# EAGLE board ce_hdd_v40 (EAGLE 6.2)
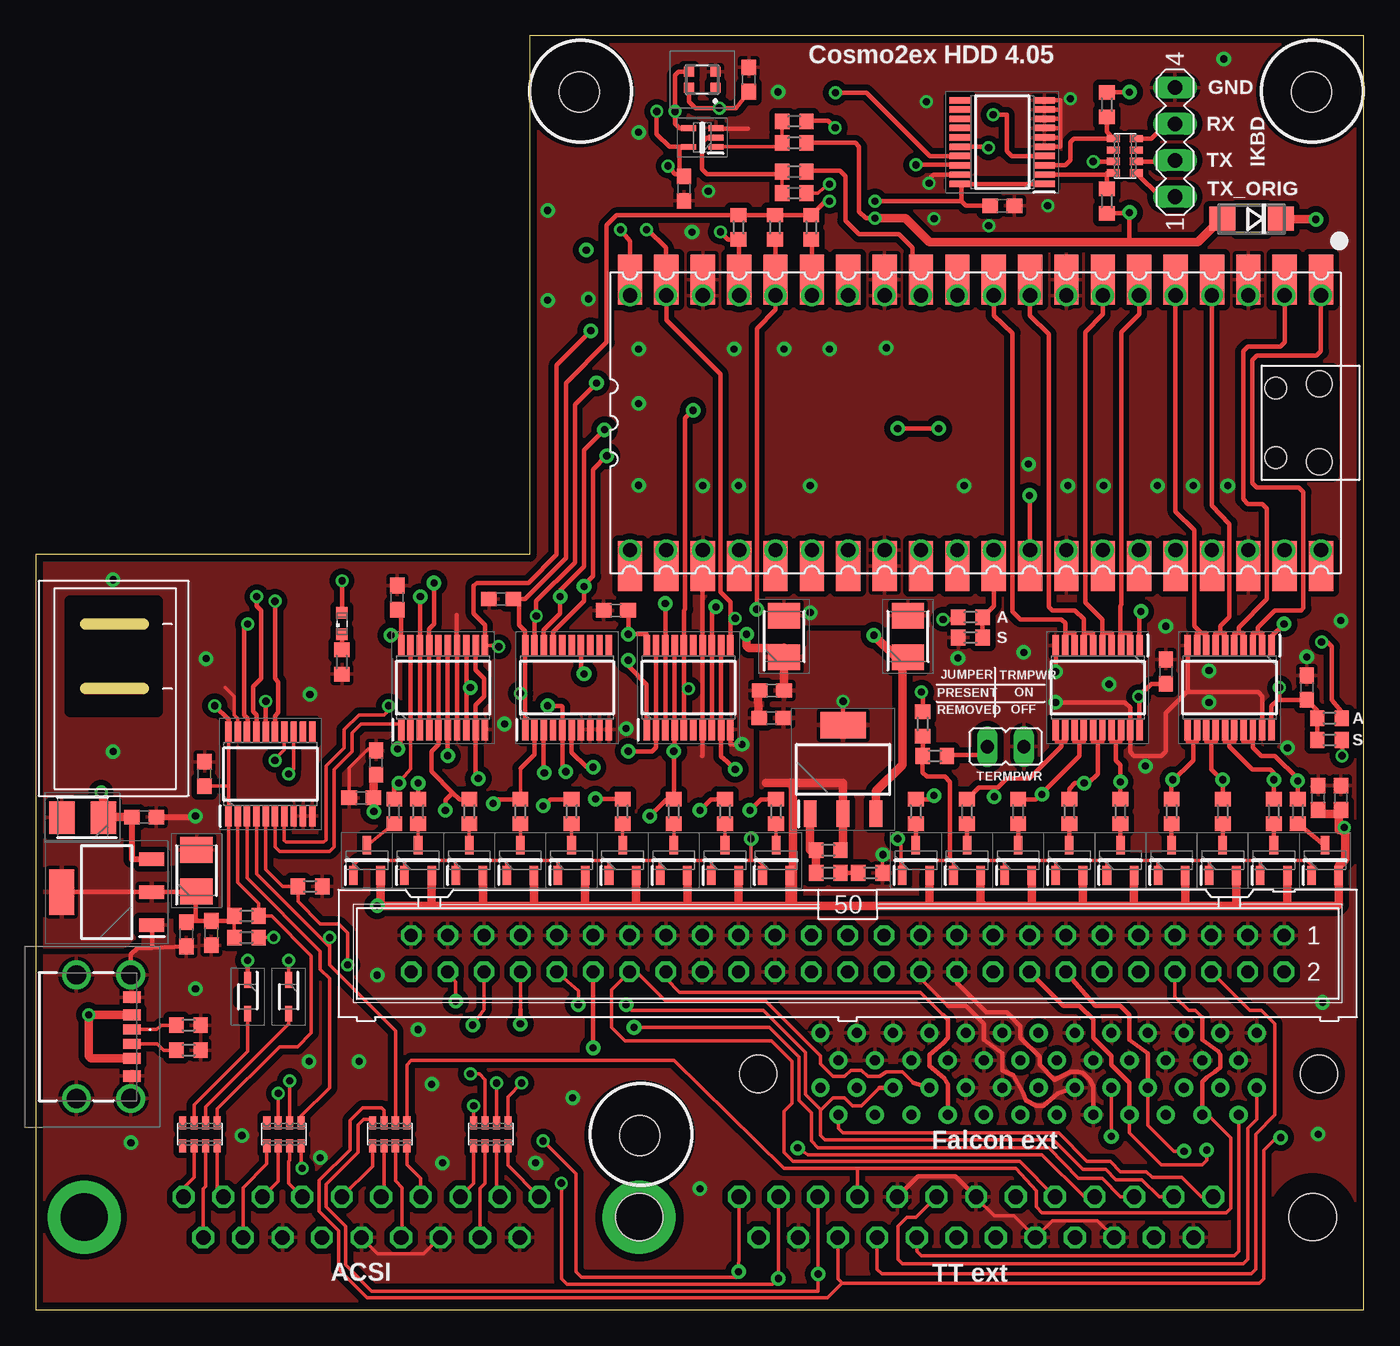
[diagram p5: board, top side]
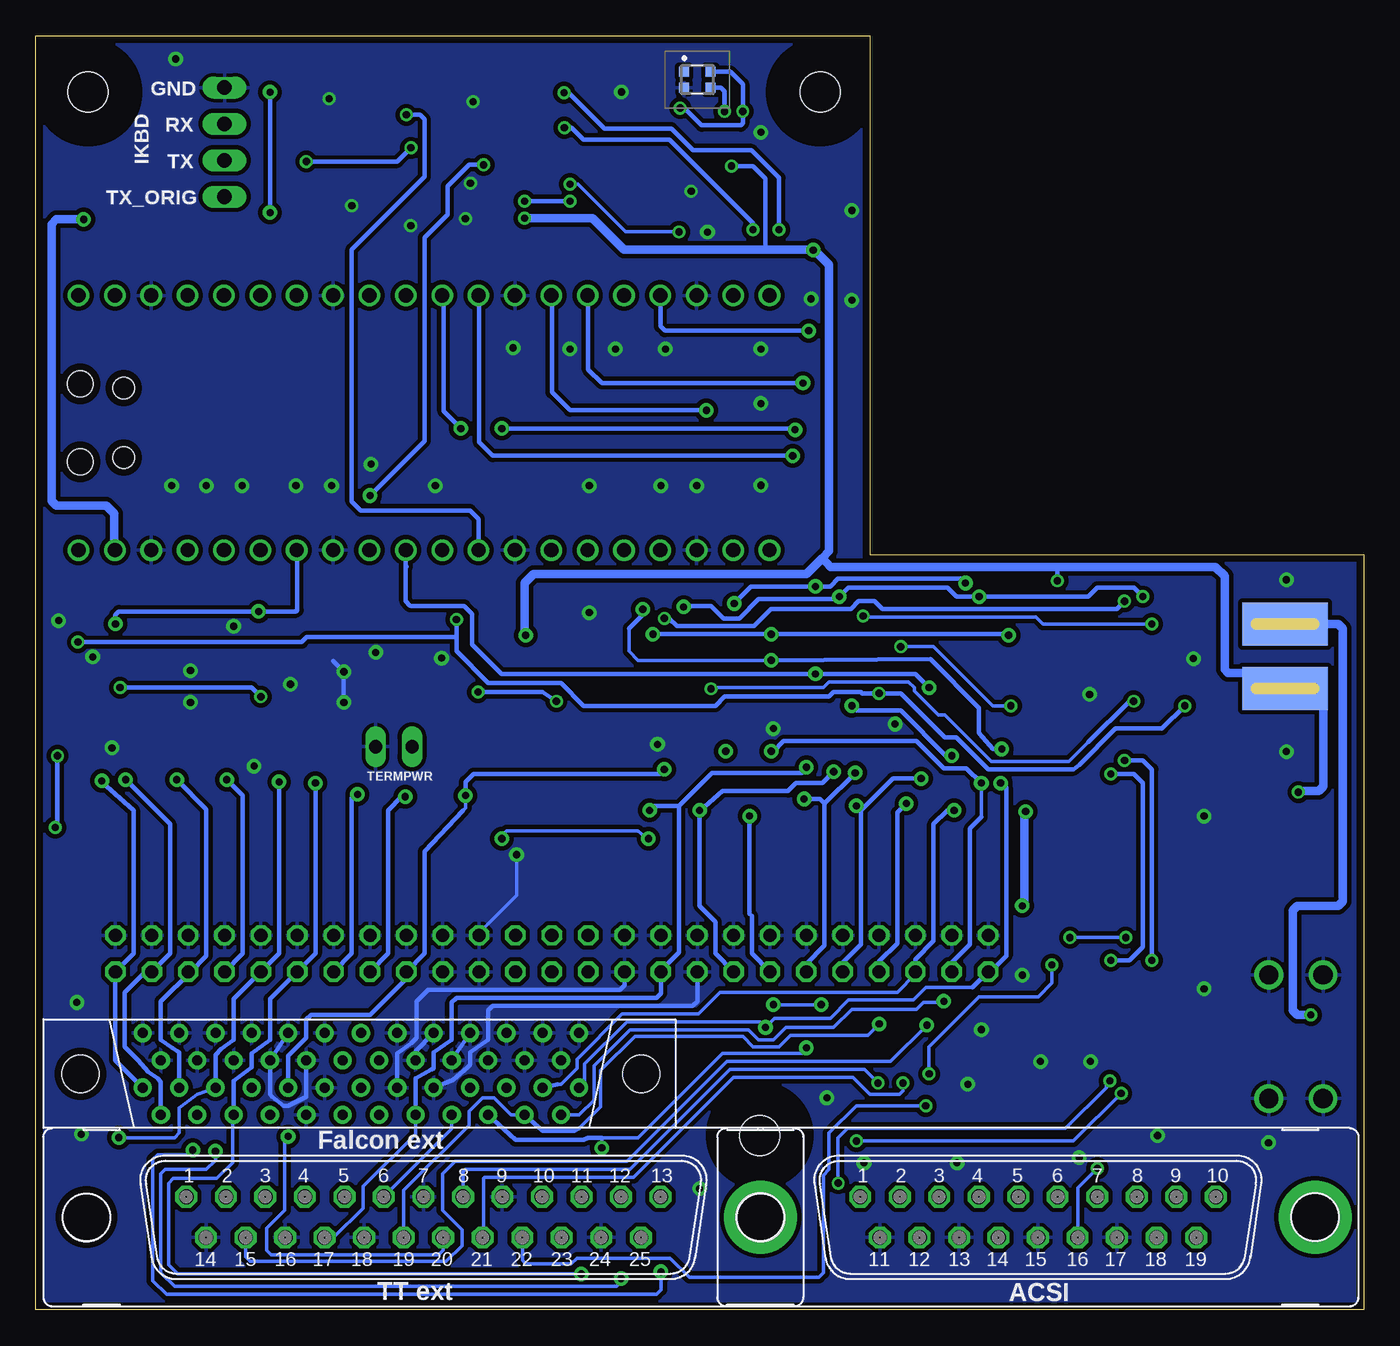
[diagram p6: board, bottom side, seen from below]

Size 92.75 x 89 mm. Coordinates in mm from the lower left corner, seen from the top.
Outline: 0,0 92.75,0 92.75,89 34.5,89 34.5,52.75 0,52.75 0,0
Copper layers (1*16): Top 0.035mm / dielectric 1.5mm / Bottom 0.035mm
Design rules: minimum track width 0.2mm, minimum drill 0.4mm, track to track 0.2mm, track to pad 0.2mm, pad to pad 0.2mm, via to via 0.2mm, smd to smd 0mil, copper to edge 0.5mm, drill to drill 0.5mm, minimum pad ring 10mil, minimum via ring 8mil, stop-mask expansion 4mil, vias tented up to drill 0mil, thermal gap 10mil
Holes 2.8 mm at 89.09,85.06 42.18,12.2 37.98,85.06
tKeepout: area 85.7,81.6 to 92.5,88.5; area 38.7,8.8 to 45.6,15.6; area 34.5,81.6 to 41.4,88.5
bKeepout: area 85.6,81.6 to 92.6,88.5; area 38.7,8.7 to 45.6,15.7; area 34.5,81.6 to 41.4,88.5
tRestrict: area 85.6,81.6 to 92.5,88.5; area 38.7,8.7 to 45.6,15.6; area 34.5,81.6 to 41.4,88.5; area 83.9,75.2 to 86,77.1; area 10.1,30.2 to 12.3,31.1; area 14.2,21.5 to 15.4,22.3; area 17.1,21.4 to 18.2,22.3; area 2.8,33.2 to 3.7,35.6; area 59.8,46.6 to 62,47.5; area 51,46.6 to 53.5,47.5
bRestrict: area 85.6,81.6 to 92.6,88.5; area 38.7,8.7 to 45.6,15.7; area 34.5,81.6 to 41.4,88.5

## Footprints (pad centres in the part's own frame; a part is rotated, then mirrored left to right if it is on the bottom)
C0603 = smd 1.1 x 1: 1 -0.85,0; 2 0.85,0
CAPPM3528X210N = smd 1.8 x 2.25: 1 -1.45,0; 2 1.45,0
DO214AC = smd 1.8 x 1.7: A 2.05,0; C -2.05,0
SOD2613X100N = smd 1.1 x 0.5: 1 -1.175,0; 2 1.175,0
PICO-PKG = drill 1: 1 -8.89,24.13; 2 -8.89,21.59; 3 -8.89,19.05; 4 -8.89,16.51; 5 -8.89,13.97; 6 -8.89,11.43; 7 -8.89,8.89; 8 -8.89,6.35; 9 -8.89,3.81; 10 -8.89,1.27; 11 -8.89,-1.27; 12 -8.89,-3.81; 13 -8.89,-6.35; 14 -8.89,-8.89; 15 -8.89,-11.43; 16 -8.89,-13.97; 17 -8.89,-16.51; 18 -8.89,-19.05; 19 -8.89,-21.59; 20 -8.89,-24.13; 21 8.89,-24.13; 22 8.89,-21.59; 23 8.89,-19.05; 24 8.89,-16.51; 25 8.89,-13.97; 26 8.89,-11.43; 27 8.89,-8.89; 28 8.89,-6.35; 29 8.89,-3.81; 30 8.89,-1.27; 31 8.89,1.27; 32 8.89,3.81; 33 8.89,6.35; 34 8.89,8.89; 35 8.89,11.43; 36 8.89,13.97; 37 8.89,16.51; 38 8.89,19.05; 39 8.89,21.59; 40 8.89,24.13 | smd 3.5 x 1.7: P$1 -10,24.13; P$2 -10,21.59; P$3 -10,19.05; P$4 -10,16.51; P$5 -10,13.97; P$6 -10,11.43; P$7 -10,8.89; P$8 -10,6.35; P$9 -10,3.81; P$10 -10,1.27; P$11 -10,-1.27; P$12 -10,-3.81; P$13 -10,-6.35; P$14 -10,-8.89; P$15 -10,-11.43; P$16 -10,-13.97; P$17 -10,-16.51; P$18 -10,-19.05; P$19 -10,-21.59; P$20 -10,-24.13; P$21 10,-24.13; P$22 10,-21.59; P$23 10,-19.05; P$24 10,-16.51; P$25 10,-13.97; P$26 10,-11.43; P$27 10,-8.89; P$28 10,-6.35; P$29 10,-3.81; P$30 10,-1.27; P$31 10,1.27; P$32 10,3.81; P$33 10,6.35; P$34 10,8.89; P$35 10,11.43; P$36 10,13.97; P$37 10,16.51; P$38 10,19.05; P$39 10,21.59; P$40 10,24.13 | hole 1.8: -2.725,24; 2.725,24 | hole 1.5: -2.425,20.97; 2.425,20.97
SOP65P640X120-20N = smd 1.475 x 0.45: 1 -2.938,2.925; 2 -2.938,2.275; 3 -2.938,1.625; 4 -2.938,0.975; 5 -2.938,0.325; 6 -2.938,-0.325; 7 -2.938,-0.975; 8 -2.938,-1.625; 9 -2.938,-2.275; 10 -2.938,-2.925; 11 2.938,-2.925; 12 2.938,-2.275; 13 2.938,-1.625; 14 2.938,-0.975; 15 2.938,-0.325; 16 2.938,0.325; 17 2.938,0.975; 18 2.938,1.625; 19 2.938,2.275; 20 2.938,2.925
SOT230P700X180-4N = smd 1.75 x 0.95: 1 -3.15,2.3; 2 -3.15,0; 3 -3.15,-2.3 | smd 1.75 x 3.2: 4 3.15,0
SOT65P212X110-5N = smd 1.05 x 0.4: 1 -0.95,0.65; 2 -0.95,0; 3 -0.95,-0.65; 4 0.95,-0.65; 5 0.95,0.65
SOP65P640X110-20N = smd 1.475 x 0.45: 1 -2.938,2.925; 2 -2.938,2.275; 3 -2.938,1.625; 4 -2.938,0.975; 5 -2.938,0.325; 6 -2.938,-0.325; 7 -2.938,-0.975; 8 -2.938,-1.625; 9 -2.938,-2.275; 10 -2.938,-2.925; 11 2.938,-2.925; 12 2.938,-2.275; 13 2.938,-1.625; 14 2.938,-0.975; 15 2.938,-0.325; 16 2.938,0.325; 17 2.938,0.975; 18 2.938,1.625; 19 2.938,2.275; 20 2.938,2.925
SOT230P700X185-4N = smd 1.85 x 0.9: 1 -3.1,2.3; 2 -3.1,0; 3 -3.1,-2.3 | smd 1.85 x 3.2: 4 3.1,0
MA04-1 = drill 1.016 long: 1 -3.81,0; 2 -1.27,0; 3 1.27,0; 4 3.81,0
USB4125GFA = smd 0.7 x 1.2: A5 -0.5,2.778; B5 0.5,2.778 | smd 0.76 x 1.2: A9 1.52,2.778; B9 -1.52,2.778 | smd 0.8 x 1.2: A12 2.75,2.778; B12 -2.75,2.778 | drill 1.34 pad 2.01: MH1 4.32,2.698; MH2 4.32,-1.102; MH3 -4.32,-1.102; MH4 -4.32,2.698
M19 = drill 1.016 octagon: 1 -12.751,1.422; 2 -9.982,1.422; 3 -7.239,1.422; 4 -4.47,1.422; 5 -1.702,1.422; 6 1.041,1.422; 7 3.81,1.422; 8 6.579,1.422; 9 9.322,1.422; 10 12.09,1.422; 11 -11.379,-1.422; 12 -8.611,-1.422; 13 -5.842,-1.422; 14 -3.099,-1.422; 15 -0.33,-1.422; 16 2.438,-1.422; 17 5.182,-1.422; 18 7.95,-1.422; 19 10.719,-1.422 | drill 3.302 pad 5.08: G1 -19.71,0; G2 19.03,0
HD50_MALE = drill 0.7 pad 1.27: P1 0,1.27; P2 1.27,-0.63; P3 2.54,1.27; P4 3.81,-0.63; P5 5.08,1.27; P6 6.35,-0.63; P7 7.62,1.27; P8 8.89,-0.63; P9 10.16,1.27; P10 11.43,-0.63; P11 12.7,1.27; P12 13.97,-0.63; P13 15.24,1.27; P14 16.51,-0.63; P15 17.78,1.27; P16 19.05,-0.63; P17 20.32,1.27; P18 21.59,-0.63; P19 22.86,1.27; P20 24.13,-0.63; P21 25.4,1.27; P22 26.67,-0.63; P23 27.94,1.27; P24 29.21,-0.63; P25 30.48,1.27; P26 0,-2.54; P27 1.27,-4.44; P28 2.54,-2.54; P29 3.81,-4.44; P30 5.08,-2.54; P31 6.35,-4.44; P32 7.62,-2.54; P33 8.89,-4.44; P34 10.16,-2.54; P35 11.43,-4.44; P36 12.7,-2.54; P37 13.97,-4.44; P38 15.24,-2.54; P39 16.51,-4.44; P40 17.78,-2.54; P41 19.05,-4.44; P42 20.32,-2.54; P43 21.59,-4.44; P44 22.86,-2.54; P45 24.13,-4.44; P46 25.4,-2.54; P47 26.67,-4.44; P48 27.94,-2.54; P49 29.21,-4.44; P50 30.48,-2.54 | hole 2.6: -4.35,-1.58; 34.83,-1.58
M25V = drill 1.016 octagon: 1 -16.561,1.422; 2 -13.792,1.422; 3 -11.049,1.422; 4 -8.28,1.422; 5 -5.512,1.422; 6 -2.769,1.422; 7 0,1.422; 8 2.769,1.422; 9 5.512,1.422; 10 8.28,1.422; 11 11.049,1.422; 12 13.792,1.422; 13 16.561,1.422; 14 -15.189,-1.422; 15 -12.421,-1.422; 16 -9.652,-1.422; 17 -6.909,-1.422; 18 -4.14,-1.422; 19 -1.372,-1.422; 20 1.372,-1.422; 21 4.14,-1.422; 22 6.909,-1.422; 23 9.652,-1.422; 24 12.421,-1.422; 25 15.189,-1.422 | hole 3.302: 23.52,0; -23.52,0
ML50 = drill 0.914 octagon: 1 -30.48,-1.27; 2 -30.48,1.27; 3 -27.94,-1.27; 4 -27.94,1.27; 5 -25.4,-1.27; 6 -25.4,1.27; 7 -22.86,-1.27; 8 -22.86,1.27; 9 -20.32,-1.27; 10 -20.32,1.27; 11 -17.78,-1.27; 12 -17.78,1.27; 13 -15.24,-1.27; 14 -15.24,1.27; 15 -12.7,-1.27; 16 -12.7,1.27; 17 -10.16,-1.27; 18 -10.16,1.27; 19 -7.62,-1.27; 20 -7.62,1.27; 21 -5.08,-1.27; 22 -5.08,1.27; 23 -2.54,-1.27; 24 -2.54,1.27; 25 0,-1.27; 26 0,1.27; 27 2.54,-1.27; 28 2.54,1.27; 29 5.08,-1.27; 30 5.08,1.27; 31 7.62,-1.27; 32 7.62,1.27; 33 10.16,-1.27; 34 10.16,1.27; 35 12.7,-1.27; 36 12.7,1.27; 37 15.24,-1.27; 38 15.24,1.27; 39 17.78,-1.27; 40 17.78,1.27; 41 20.32,-1.27; 42 20.32,1.27; 43 22.86,-1.27; 44 22.86,1.27; 45 25.4,-1.27; 46 25.4,1.27; 47 27.94,-1.27; 48 27.94,1.27; 49 30.48,-1.27; 50 30.48,1.27
JP1 = drill 0.914 long: 1 0,-1.27; 2 0,1.27
SML0603 = smd 0.8 x 0.8: A 0.75,0; C -0.75,0
WS2812C2020 = smd 0.7 x 0.7: 1 0.915,-0.55; 2 0.915,0.55; 3 -0.915,0.55; 4 -0.915,-0.55
SOT95P237X112-3N = smd 1.3 x 0.6: 1 -1.05,0.95; 2 -1.05,-0.95; 3 1.05,0
R0603 = smd 1 x 1.1: 1 -0.85,0; 2 0.85,0
CTS742C083 = smd 0.5 x 0.9: 1 -1.2,-0.8; 2 -0.4,-0.8; 3 0.4,-0.8; 4 1.2,-0.8; 5 1.2,0.8; 6 0.4,0.8; 7 -0.4,0.8; 8 -1.2,0.8
SMRS-1 = smd 3 x 6 bottom: P$1 11.5,4.7; P$2 7,4.7

## Placement (x,y rotation side)
C1  100 nF  [C0603]  67.5,77.13 180 top
C2  100 nF  [C0603]  88.78,43.47 90 top
C3  100 nF  [C0603]  78.93,44.58 90 top
C4  10 uF  [CAPPM3528X210N]  11.23,30.69 90 top
C5  100 nF  [C0603]  12.26,26.33 270 top
C6  1 uF  [C0603]  10.51,26.25 270 top
C7  10 uF  [CAPPM3528X210N]  3.27,34.39 180 top
C8  1 uF  [C0603]  7.57,34.42 0 top
C9  100 nF  [C0603]  45.28,78.32 270 top
C10  100 nF  [C0603]  49.8,85.94 90 top
C101  1 uF  [C0603]  11.78,37.44 90 top
C201  100 nF  [C0603]  32.5,49.66 180 top
C202  100 nF  [C0603]  51.41,43.27 180 top
C203  1 uF  [C0603]  51.37,41.35 180 top
C204  100 nF  [C0603]  40.52,48.87 180 top
C205  100 nF  [C0603]  25.25,49.76 90 top
C206  10 uF  [CAPPM3528X210N]  60.91,47.04 90 top
C207  10 uF  [CAPPM3528X210N]  52.26,47.04 90 top
C208  100 nF  [C0603]  22.73,35.77 180 top
C209  100 nF  [C0603]  89.57,35.77 90 top
C210  1 uF  [C0603]  23.77,38.23 90 top
C211  1 uF  [C0603]  91.16,35.77 90 top
D1  SK110-DIO  [DO214AC]  84.92,76.22 180 top
D101  BAT54WSTR  [SOD2613X100N]  14.8,21.88 270 top
D102  BAT54WSTR  [SOD2613X100N]  17.66,21.88 270 top
IC1  RASPBERRY_PICOSMD-TH  [PICO-PKG]  65.64,61.97 270 top
IC2  74LVC245AT20-13  [SOP65P640X120-20N]  83.38,43.47 270 top
IC3  74LVC245AT20-13  [SOP65P640X120-20N]  74.17,43.47 270 top
IC4  TLV1117LV33DCYR  [SOT230P700X180-4N]  4.95,29.18 180 top
IC5  74LVC245AT20-13  [SOP65P640X120-20N]  67.5,81.57 180 top
IC6  74AHCT1G08GW,125  [SOT65P212X110-5N]  46.55,81.89 180 top
IC101  74LVC245AT20-13  [SOP65P640X120-20N]  16.39,37.44 90 top
IC201  74LVC245AT20-13  [SOP65P640X120-20N]  37.1,43.47 90 top
IC202  74LVC373APW,118  [SOP65P640X110-20N]  28.45,43.47 90 top
IC203  74LVC373APW,118  [SOP65P640X110-20N]  45.59,43.47 90 top
IC204  AZ1117H-ADJTRE1  [SOT230P700X185-4N]  56.39,37.76 90 top
J1  [MA04-1]  79.57,81.57 90 top
J2  USB4125-GF-A  [USB4125GFA]  3.94,19.09 270 top
J101  M19  [M19]  22.42,6.48 0 bottom
J201  TE Connectivity - 5173280-3  [HD50_MALE]  85.28,18.07 0 bottom
J202  [M25V]  65.68,6.48 0 bottom
J203  ZL231-50PG  [ML50]  56.71,24.9 180 top
JP201  [JP1]  67.74,39.34 270 top
LED1  [SML0603]  21.39,47.94 90 top
LED2  WS2812C-2020  [WS2812C2020]  46.55,85.94 0 top
LED3  WS2812C-2020  [WS2812C2020]  46.55,85.94 180 bottom
Q201  FDV304P  [SOT95P237X112-3N]  90.05,31.41 90 top
Q202  FDV304P  [SOT95P237X112-3N]  86.47,31.41 90 top
Q203  FDV304P  [SOT95P237X112-3N]  82.9,31.41 90 top
Q204  FDV304P  [SOT95P237X112-3N]  79.33,31.41 90 top
Q205  FDV304P  [SOT95P237X112-3N]  75.76,31.41 90 top
Q206  FDV304P  [SOT95P237X112-3N]  72.19,31.41 90 top
Q207  FDV304P  [SOT95P237X112-3N]  68.61,31.41 90 top
Q208  FDV304P  [SOT95P237X112-3N]  65.04,31.41 90 top
Q209  FDV304P  [SOT95P237X112-3N]  61.47,31.41 90 top
Q210  FDV304P  [SOT95P237X112-3N]  51.71,31.41 90 top
Q211  FDV304P  [SOT95P237X112-3N]  48.13,31.41 90 top
Q212  FDV304P  [SOT95P237X112-3N]  44.56,31.41 90 top
Q213  FDV304P  [SOT95P237X112-3N]  40.99,31.41 90 top
Q214  FDV304P  [SOT95P237X112-3N]  37.42,31.41 90 top
Q215  FDV304P  [SOT95P237X112-3N]  33.85,31.41 90 top
Q216  FDV304P  [SOT95P237X112-3N]  30.28,31.41 90 top
Q217  FDV304P  [SOT95P237X112-3N]  26.7,31.41 90 top
Q218  FDV304P  [SOT95P237X112-3N]  23.13,31.41 90 top
R1  10k  [R0603]  74.81,77.44 270 top
R2  10k  [R0603]  74.81,84.19 90 top
R3  5k1 (1%)  [R0603]  10.67,19.9 0 top
R4  5k1 (1%)  [R0603]  10.67,18.15 0 top
R5  1k  [R0603]  21.38,45.26 270 top
R6  10k  [R0603]  54.17,75.62 270 top
R7  10k  [R0603]  51.63,75.62 270 top
R8  10k  [R0603]  49.09,75.62 270 top
R101  0R  [R0603]  90.36,41.33 0 top
R102  10k  [R0603]  14.72,27.52 0 top
R103  10k  [R0603]  14.72,26.01 0 top
R104  10k  [R0603]  19.16,29.58 180 top
R125  100k  [R0603]  65.28,48.39 0 top
R150  220R  [R0603]  52.98,79.51 0 top
R151  10k  [R0603]  52.98,81.52 0 top
R201  0R  [R0603]  90.36,39.82 0 top
R202  10k  [R0603]  61.95,40.93 270 top
R203  220R  [R0603]  62.79,38.7 0 top
R204  110 R  [R0603]  88.14,34.82 90 top
R205  110 R  [R0603]  86.47,34.82 90 top
R206  110 R  [R0603]  82.9,34.82 90 top
R207  110 R  [R0603]  79.33,34.82 90 top
R208  110 R  [R0603]  75.76,34.82 90 top
R209  110 R  [R0603]  72.19,34.82 90 top
R210  110 R  [R0603]  68.61,34.82 90 top
R211  110 R  [R0603]  65.04,34.82 90 top
R212  110 R  [R0603]  61.47,34.82 90 top
R213  110 R  [R0603]  51.71,34.82 90 top
R214  110 R  [R0603]  48.13,34.82 90 top
R215  110 R  [R0603]  44.56,34.82 90 top
R216  110 R  [R0603]  40.99,34.82 90 top
R217  110 R  [R0603]  37.42,34.82 90 top
R218  110 R  [R0603]  33.85,34.82 90 top
R219  110 R  [R0603]  30.28,34.82 90 top
R220  110 R  [R0603]  26.7,34.82 90 top
R221  110 R  [R0603]  25.04,34.82 90 top
R222  120 R - 1%  [R0603]  55.36,32.12 180 top
R223  150 R  [R0603]  55.36,30.53 0 top
R224  4.7 R  [R0603]  58.3,30.53 180 top
R225  100k  [R0603]  65.28,46.97 180 top
R250  220R  [R0603]  52.98,78 0 top
R251  220R  [R0603]  52.98,83.03 0 top
RN1  DR1206-47R-4/8  [CTS742C083]  76.08,80.62 270 top
RN101  DR1206-47R-4/8  [CTS742C083]  31.78,12.28 0 top
RN102  DR1206-47R-4/8  [CTS742C083]  24.72,12.28 0 top
RN103  DR1206-47R-4/8  [CTS742C083]  17.34,12.28 0 top
RN104  DR1206-47R-4/8  [CTS742C083]  11.46,12.28 0 top
SW1  SMSR-1  [SMRS-1]  10.19,36.41 90 top

## Tracks (layer width: path | path; a pad name or v marks a point on that pad's centre or on a via)
3V3(OUT)
  Top 0.305: IC1.P$36 IC1.36
5V  (via drill 0.5, 0.5 pad 1.02)
  Top 0.305: IC204.3 58.69,34.76 | R1.2 76.34,76.59 v76.39,76.65 76.39,74.59 | v76.39,85.06 74.83,85.06 R2.2 | 38.21,74.27 v38.45,74.03 | C9.1 45.1,79.35 | 45.1,79.35 44.64,79.35 v44.17,79.91 | 44.96,81.24 IC6.5 | 45.1,79.35 44.96,79.49 44.96,81.24 | LED1.A 21.39,51.09 v21.39,50.93 | 44.96,81.24 44.26,81.24 43.37,82.13 v43.37,83.72 | R151.2 57.23,81.52 57.5,81.25 57.5,76.73 57.98,76.25 v58.61,76.25 | C10.1 48.9,83.95 v47.74,83.95 46.07,83.95 45.63,84.39 LED2.4
  Top 0.406: IC4.3 6.72,31.48 C8.1
  Top 0.61: 60.52,45.38 60.52,38.08 58.69,36.25 58.69,34.76 | 60.52,45.38 60.52,45.54 | v58.53,47.12 60.06,45.59 C206.1 60.91,45.38 60.52,45.38 | C8.1 4.25,34.42 C7.1 4.72,36.01 v4.56,36.17 | D1.A 82.84,76.25 82.82,76.25 81.16,74.59 76.39,74.59 62.42,74.59 60.76,76.25 v58.61,76.25
  Bottom 0.305: v76.39,76.65 v76.39,85.06 | v38.45,74.03 38.41,74.07 | v44.17,79.91 42.66,79.91 41.78,79.03 41.78,74.07 | v21.39,50.93 21.39,51.89 | v47.74,83.95 47.45,83.95 46.25,82.75 43.5,82.75 43.37,82.88 v43.37,83.72 43.37,85.62 44.24,86.49 LED3.4
  Bottom 0.61: 58.53,47.36 v58.53,47.12 58.61,47.2 58.61,50.77 57.98,51.41 38.93,51.41 37.82,52.52 | 37.82,52.52 37.34,53 37.34,73 38.41,74.07 41.78,74.07 51.67,74.07 53.85,76.25 v58.61,76.25 | v4.56,36.17 4.24,36.25 3.13,36.25 2.81,36.57 2.81,43.41 SW1.P$2 7.19,43.41 8.29,44.5 9.48,44.5 9.72,44.74 9.72,51.25 10.35,51.89 21.39,51.89 37.26,51.89 37.82,52.52
5V_IN  (via drill 0.5)
  Top 0.61: J2.B9 v3.69,20.61 3.69,17.76 3.87,17.57 J2.A9
  Bottom 0.61: SW1.P$1 1.78,47.91 1.46,47.59 1.46,28.55 1.78,28.23 4.64,28.23 4.95,27.91 4.95,20.93 4.64,20.61 v3.69,20.61
AA1  (via drill 0.5)
  Top 0.254: v18.61,9.9 18.54,9.97 RN103.4
  Bottom 0.254: 18.53,9.82 v18.61,9.9 19.98,8.53 J101.16
AAAA
  Top 0.305: Q201.3 R204.1
AACK
  Top 0.254: J101.14 25.59,5.14 25.59,8.55 25.12,9.02 RN102.3
ACK  (via drill 0.5 pad 1.02)
  Top 0.254: J202.5 68.73,10.37 52.9,10.37 52.26,11.01 52.26,13.87 52.82,14.42 52.82,17.36 51.39,18.79 41.15,18.79 40.2,19.74 40.2,22.36 J203.38 | 61.31,15.85 60.52,16.64 59.41,16.64 58.93,16.33 58.14,16.33 57.66,16.72 56.95,16.72 56.47,16.33 55.68,16.33 54.8,17.2 54.8,17.76 50.99,21.56 44.01,21.56 41.94,23.63 J203.38 | 41.47,23.55 J203.38
  Top 0.305: IC203.17 IC203.4 44.62,39.08 v44.56,39.03 R215.2 44.06,35.67 v42.9,34.5 | 61.31,15.85 J201.P44
  Bottom 0.305: v44.56,39.03 44.33,39.03 | J203.38 42.74,24.9 42.74,27.52 42.9,27.68 v42.9,34.5
ACS
  Top 0.254: J101.9 12.66,8.34 RN104.4
AD0
  Top 0.254: J101.1 32.98,10.09 RN101.4
AD1
  Top 0.254: J101.2 32.18,8.12 RN101.3
AD2
  Top 0.254: J101.3 30.58,8.83 RN101.1
AD3
  Top 0.254: J101.4 26.86,7.93 26.86,9.18 25.92,10.13 RN102.4
AD4
  Top 0.254: J101.5 24.32,8.11 RN102.2
AD5
  Top 0.254: J101.6 23.52,10.05 RN102.1
AD6
  Top 0.254: J101.7 17.66,8.86 17.66,10.37 17.74,10.46 RN103.3
AD7
  Top 0.254: J101.8 16.94,9.01 RN103.2
ADRQ
  Top 0.254: J101.19 11.7,8.47 11.86,8.63 RN104.3
AINT
  Top 0.254: J101.10 10.33,8.52 11.06,9.26 RN104.2
ARESET
  Top 0.254: J101.12 31.03,8.51 31.38,8.86 RN101.2
ARNW
  Top 0.254: J101.18 14.47,8.54 16.14,10.21 RN103.1
ATN  (via drill 0.5 pad 1.02)
  Top 0.305: IC201.6 37.43,38.94 38.45,37.92 v38.93,37.92 | v49.88,34.9 50.65,35.67 R213.2
  Bottom 0.254: J202.17 71.94,5.06 69.88,7.12 69.88,8.63 66.23,12.28 J201.P41
  Bottom 0.305: J201.P41 66.23,16.17 65.12,16.8 64.96,16.88 64.96,17.99 63.69,18.87 63.69,21.49 63.38,21.8 49.41,21.8 49.09,22.12 J203.32 | J203.32 49.09,23.79 | v49.88,34.9 49.56,35.22 47.82,35.22 | v38.93,37.92 39.24,37.52 45.52,37.52 47.82,35.22 | J203.32 49.09,23.71 47.82,24.98 47.82,35.22
ATN_MSG  (via drill 0.5 pad 1.02)
  Top 0.305: IC202.13 30.07,43.47 | 30.07,43.47 IC202.8 | IC1.P$31 IC1.31 66.91,49.17 R125.2 R225.1 | IC201.14 38.08,44.64 v38.29,44.42 | 30.07,43.47 v30.36,43.47
  Bottom 0.305: 66.87,51.93 IC1.P$31 | IC1.P$31 IC1.31 | v30.36,43.47 31.31,44.42 v38.29,44.42 60.2,44.42 62.27,46.49 62.27,48.62 62.84,49.19 66.55,49.19 66.62,49.2 66.91,49.51 IC1.P$31
BA1
  Top 0.254: RN103.5 18.54,13.56 20.51,15.53 20.51,23.15 19.88,23.79 19.88,25.06 14.76,30.18 IC101.3
BACK  (via drill 0.5)
  Top 0.254: RN102.6 25.12,19.5 20.51,24.11 20.51,25.38 | 20.51,25.38 15.43,30.45 15.43,34.48 IC101.4 | R103.2 v16.62,26.01 | v20.51,26.01 20.51,25.38
  Bottom 0.254: v16.62,26.01 v20.51,26.01
BCS
  Top 0.254: IC101.2 14.11,29.87 15.57,28.41 R102.2 16.46,27.52 19.24,24.74 19.24,19.34 18.29,18.39 17.02,18.39 12.66,14.03 RN104.5
BRESET  (via drill 0.5)
  Top 0.254: RN101.7 31.38,16.09 30.99,16.48 v30.36,16.48 | IC101.5 16.06,31.41 16.07,31.25 16.07,30.77 17.26,29.58 R104.2 18.31,28.53 19.88,26.96 21.15,26.96 21.78,26.33 v21.78,24.11
  Bottom 0.254: v30.36,16.48 30.36,18.39 26.86,21.88 22.73,21.88 21.78,22.84 v21.78,24.11
BSY  (via drill 0.5 pad 1.02)
  Top 0.254: 63.38,20.61 61.79,22.2 44.96,22.2 44.01,23.15 J203.36
  Top 0.305: IC202.15 IC202.6 v28.77,38.71 | 63.38,20.61 63.69,20.3 63.69,19.02 63.38,18.63 62.42,17.83 62.42,17.04 63.45,16.17 63.61,15.93 63.69,15.77 J201.P43 | v35.75,42.2 36.7,42.2 36.78,42.13 IC201.5 36.78,37.84 v37.02,37.6 | v46.39,34.9 47.16,35.67 R214.2
  Bottom 0.254: J202.6 63.69,12.66 J201.P43
  Bottom 0.305: J203.36 45.28,24.9 45.28,27.12 46.39,28.23 v46.39,34.9 46.31,34.9 44.8,36.25 40.2,36.25 39.64,36.8 37.82,36.8 v37.02,37.6 | v35.75,42.2 35.44,41.88 32.34,41.88 29.16,38.71 v28.77,38.71
C0
  Top 0.254: IC1.1 IC1.P$1
  Top 0.305: IC2.2 85.65,47.28 85.36,47.28 | 85.36,47.28 85,47.28 IC2.3 | 85.36,47.28 85.36,47.68 86.55,48.87 88.38,48.87 88.54,49.03 88.54,57.12 88.22,57.44 85.28,57.44 84.97,57.76 84.97,66.33 85.28,66.65 89.45,66.65 89.77,66.97 IC1.1
C1
  Top 0.254: IC1.2 IC1.P$2
  Top 0.305: IC2.4 84.33,46.41 84.33,47.28 84.01,47.28 | 84.01,47.28 83.7,47.28 IC2.5 | 84.01,47.28 84.01,47.68 86,49.66 86,55.99 85.68,56.31 84.65,56.31 84.33,56.62 84.33,66.97 84.65,67.28 86.91,67.28 87.23,67.6 IC1.2
C2
  Top 0.254: IC1.4 IC1.P$4
  Top 0.305: IC2.7 82.4,47.28 82.74,47.28 | 82.74,47.28 83.05,47.28 IC2.6 | 82.74,47.28 82.74,47.76 83.38,48.39 83.38,54.9 82.15,56.17 IC1.4
C3
  Top 0.254: IC1.5 IC1.P$5
  Top 0.305: IC2.9 81.1,47.28 81.39,47.28 | 81.39,47.28 81.75,47.28 IC2.8 | 81.39,47.28 80.92,47.76 80.92,54.48 79.61,55.78 IC1.5
C4
  Top 0.254: IC1.6 IC1.P$6
  Top 0.305: IC3.3 75.76,46.41 75.76,47.28 | 75.76,47.28 76.44,47.28 IC3.2 | 75.76,47.28 75.76,49.19 75.84,49.27 75.84,68.32 77.07,69.55 IC1.6
C5
  Top 0.254: IC1.7 IC1.P$7
  Top 0.305: IC3.5 74.49,46.41 74.49,47.28 | 74.49,47.28 75.14,47.28 IC3.4 | 74.49,47.28 74.49,48.23 73.3,49.43 73.3,68.32 74.53,69.55 IC1.7
C6
  Top 0.254: IC1.9 IC1.P$9
  Top 0.305: IC3.7 73.19,47.28 | 73.19,47.28 73.84,47.28 IC3.6 | 73.19,47.28 73.19,48.26 72.58,48.87 71,48.87 70.76,49.11 70.76,68.16 69.45,69.47 IC1.9
C7
  Top 0.254: IC1.10 IC1.P$10
  Top 0.305: IC3.9 71.89,47.28 | 71.89,47.28 72.55,47.28 IC3.8 | 71.89,47.28 71.89,47.97 71.63,48.23 68.77,48.23 68.22,48.79 68.22,68.24 66.91,69.47 IC1.10
C/D  (via drill 0.5 pad 1.02)
  Top 0.254: J203.46 31.31,21.01 v30.51,19.9
  Top 0.305: IC202.16 IC202.5 28.12,39.5 27.66,39.03 27.66,37.6 29.12,36.13 | R219.2 29.58,35.67 29.12,36.13 | v28.61,34.9 28.61,35.61 29.12,36.13
  Bottom 0.254: J202.15 78.1,3.71 77.78,3.39 64.09,3.39 62.98,4.5 62.98,5.61 64.33,6.96 64.33,9.5 63.45,10.37 51.47,10.37 44.48,17.36 33.05,17.36 v30.51,19.9 30.59,19.66 | 30.04,25.85 30.04,25.77 | J203.46 31.31,23.47 32.58,22.2 44.96,22.2 46.47,20.69 51.79,20.69 54.96,17.52 54.96,16.88 56.07,15.77 56.31,15.77
  Bottom 0.305: 30.04,25.85 30.04,33.95 29.09,34.9 v28.61,34.9 | 56.31,15.77 J201.P48 | 30.04,25.77 31.31,24.5 J203.46
CACK  (via drill 0.5, 0.5 pad 1.02)
  Top 0.254: IC1.14 IC1.P$14
  Top 0.305: 45.27,43.42 IC203.16 45.28,48.87 45.36,48.95 45.36,62.28 v45.91,62.84 | 45.27,43.42 IC203.5 | 45.27,43.42 45.32,43.39 v45.59,43.39 | v16.07,42.52 IC101.16
  Bottom 0.254: v45.59,43.39 45.28,43.47 37.74,43.47 37.34,43.87 31.78,43.87 31.39,43.47 31.39,43.23 29.72,41.57 29.24,41.57 25.99,38.31 20.59,38.31 19.24,39.66
  Bottom 0.305: v45.91,62.84 55.44,62.84 56.71,64.11 56.71,70.82 IC1.14 | 19.24,39.66 16.39,42.52 v16.07,42.52
CKEYB_RX
  Top 0.305: R2.1 74.81,82.29 RN1.1 72.51,81.82 72.27,81.57 72.27,80.3 71.91,79.95 IC5.3
CKEYB_TX  (via drill 0.5)
  Top 0.305: RN1.3 v73.86,80.22 v73.85,80.22 | v66.55,81.18 66.48,81.25 IC5.16
  Bottom 0.305: v73.85,80.22 67.5,80.22 v66.55,81.18
CKEYB_TX_ORIG
  Top 0.305: R1.1 74.81,79.35 | 74.81,79.35 74.81,79.42 RN1.4 75.2,79.35 74.81,79.35 | IC5.2 74.75,79.3 74.81,79.35
D0  (via drill 0.5, 0.5 pad 1.02)
  Top 0.254: J202.8 61.49,6.48 60.84,6.48 60.2,5.85 60.2,3.55 60.52,3.23 84.33,3.23 84.65,3.55 84.65,12.68 85.28,13.31 J201.P26 | v33.93,15.85 32.98,14.89 RN101.5
  Top 0.305: IC2.18 85,39.66 | 85,39.66 84.33,39.66 84.33,40.53 IC2.17 | 85,39.66 85,39.31 85.6,38.71 86.55,38.71 88.14,37.12 88.22,37.12 v88.14,36.96 R204.2
  Bottom 0.254: J202.8 62.91,9.65 62.74,9.82 51.23,9.82 44.25,16.8 34.88,16.8 v33.93,15.85
  Bottom 0.305: J201.P26 87.19,17.44 J203.2 85.92,24.9 85.92,34.9 88.14,36.88 v88.14,36.96
D1  (via drill 0.5, 0.5 pad 1.02)
  Top 0.254: J202.21 61.54,4.1 61.85,3.79 83.69,3.79 84.01,4.1 J201.P27 | v32.18,15.85 32.18,15.93 RN101.6
  Top 0.305: IC2.16 83.7,39.66 83.38,39.66 | 83.38,39.66 83.05,39.66 IC2.15 | 83.38,39.66 83.38,39.34 84.97,37.76 86.23,37.76 86.47,37.52 v86.47,37.04 R205.2
  Bottom 0.254: J202.21 61.47,5.13 61.47,9.18 61.39,9.26 50.99,9.26 44.01,16.25 35.67,16.25 34.48,15.06 32.42,15.06 32.18,15.29 v32.18,15.85
  Bottom 0.305: J201.P27 84.01,15.93 84.25,16.17 84.89,16.64 85.6,17.44 86.55,18.39 86.55,22.2 85.12,23.63 J203.4 83.38,24.9 83.38,33.95 v86.47,37.04
D2  (via drill 0.5, 0.5 pad 1.02)
  Top 0.254: J202.22 58.77,2.83 59.09,2.51 84.89,2.51 85.2,2.83 85.2,12.28 86.55,13.63 86.55,19.98 85.6,20.93 84.81,20.93 J203.6 | v30.59,14.26 30.58,14.19 RN101.8
  Top 0.305: IC2.14 82.42,40.53 82.42,39.66 82.11,39.66 | 82.11,39.66 81.75,39.66 IC2.13 | R206.2 82.9,36.96 82.82,37.04 | 82.82,37.04 82.11,37.76 82.11,39.66 | v82.9,37.04 82.82,37.04
  Bottom 0.254: 30.51,14.18 v30.59,14.26 35.44,14.26 37.34,12.36 37.34,9.82 37.74,9.42 37.74,2.59 38.05,2.28 47.1,2.28 48.45,3.63 54.96,3.63 55.36,3.23 58.53,3.23 58.77,3.46 J202.22
  Bottom 0.305: 81.95,23.63 80.84,24.74 80.84,34.98 v82.9,37.04 | 81.95,23.63 J203.6 | 81.95,23.63 84.01,21.56 84.01,18.87 83.22,18.31 82.82,18.07 82.74,17.99 J201.P28
D3  (via drill 0.5 pad 1.02)
  Top 0.254: J202.10 57.4,9.9 | 57.4,9.9 68.45,9.9 69.88,8.31 69.88,7.2 70.28,6.8 83.14,6.8 83.46,7.12 83.46,12.04 81.86,13.63 J201.P29 | 81.47,20.45 81,20.93 80.52,20.93 79.57,21.88 J203.8 | 57.4,9.9 52.26,9.9 44.56,17.44 26.23,17.44 25.92,17.13 RN102.5
  Top 0.305: IC2.11 80.45,39.66 80.84,39.66 | 80.84,39.66 81.1,39.66 IC2.12 | 81.47,20.45 81.47,18.87 82.58,18.07 82.74,17.83 82.74,16.96 82.35,16.64 81.79,16.25 81.47,15.93 J201.P29 | R207.2 79.33,36.88 | 79.33,36.88 80.84,38.39 80.84,39.66 | v79.41,37.04 79.33,36.88
  Bottom 0.305: J203.8 78.3,24.9 78.3,35.93 v79.41,37.04
D4  (via drill 0.5 pad 1.02)
  Top 0.254: J202.23 56.02,2.2 56.34,1.88 | 56.34,1.88 85.44,1.88 85.76,2.2 85.76,11.17 86.63,12.04 v86.95,12.04 | 56.34,1.88 56.31,1.88 55.28,0.85 23.13,0.85 21.15,2.83 21.15,5.53 19.8,6.88 19.8,9.05 21.94,11.19 21.94,13.23 22.81,14.1 24.15,14.1 24.32,13.93 RN102.7
  Top 0.305: IC3.17 75.14,39.66 | 75.14,39.66 75.12,39.66 | 75.14,39.66 75.44,39.66 | 75.44,39.66 75.76,39.66 75.76,40.53 IC3.18 | R208.2 v75.76,36.88 75.76,38.08 75.44,38.39 75.44,39.66
  Bottom 0.254: v86.95,12.04 83.06,12.04 82.74,12.36 82.74,14.1 81.47,15.06 J201.P30
  Bottom 0.305: J201.P30 80.2,17.83 79.81,18.23 78.93,18.87 78.93,21.72 J203.10 75.76,24.9 75.76,36.8 75.68,36.88 v75.76,36.88
D5  (via drill 0.5 pad 1.02)
  Top 0.254: J202.11 54.63,2.51 v54.64,2.51 54.64,1.32 23.45,1.32 21.62,3.15 21.62,5.85 20.27,7.2 20.27,8.77 22.5,11 22.5,12.92 22.89,13.31 23.29,13.31 RN102.8
  Top 0.305: IC3.15 73.84,39.66 74.17,39.66 | 74.17,39.66 74.49,39.66 74.49,40.53 IC3.16 | R209.2 72.19,36.41 72.58,36.8 v73.22,36.8 73.53,36.8 74.17,37.44 74.17,39.66
  Bottom 0.254: v54.64,2.51 82.82,2.51 83.46,3.15 83.46,8.87 83.14,9.18 80.12,9.18 79.01,10.29 79.01,13.55 J201.P31
  Bottom 0.305: v73.22,36.8 73.22,24.9 J203.12 76.39,21.72 76.39,18.87 77.66,17.91 77.66,16.96 78.93,16.01 J201.P31
D6  (via drill 0.5, 0.5 pad 1.02)
  Top 0.254: J202.12 51.87,7.91 v51.87,2.2 51.47,1.8 37.1,1.8 36.7,2.2 v36.7,8.87 | v80.2,11.09 79.49,11.09 77.66,12.91 J201.P32 | v17.73,16.01 RN103.6
  Top 0.305: IC3.13 72.55,39.66 72.9,39.66 | 72.9,39.66 73.22,39.66 73.22,40.53 IC3.14 | J203.14 74.01,21.25 75.76,21.25 76.39,20.61 76.39,18.87 77.66,17.91 J201.P32 | R210.2 69.86,35.67 70.32,36.13 | 70.32,36.13 72.9,38.71 72.9,39.66 | v70.28,36.01 70.32,35.97 70.32,36.13
  Bottom 0.254: v51.87,2.2 51.87,1.96 52.18,1.64 83.06,1.64 84.01,2.59 84.01,9.5 83.69,9.82 80.84,9.82 80.2,10.45 v80.2,11.09 | 17.89,15.61 17.73,15.77 v17.73,16.01 17.97,15.77 17.97,15.53 20.83,12.68 36.07,12.68 36.7,12.04 v36.7,8.87
  Bottom 0.305: v70.28,36.01 70.44,36.01 70.68,35.77 70.68,24.9 J203.14
D7  (via drill 0.5, 0.5 pad 1.02)
  Top 0.254: J202.13 49.12,4.05 v49.09,2.67 49.09,2.28 38.13,2.28 37.74,2.67 37.74,9.5 v35.44,11.8 | v81.79,11.17 81.79,10.45 81.47,10.13 78.61,10.13 76.39,12.36 J201.P33 | v16.94,15.14 RN103.7
  Top 0.305: IC3.12 71.89,39.66 71.63,39.66 | 71.63,39.66 71.31,39.66 71.31,40.53 IC3.11 | J203.16 71.79,21.25 72.9,21.25 73.85,20.3 73.85,19.02 75.12,17.76 75.12,17.12 76.39,15.85 J201.P33 | R211.2 65.86,36.49 66.95,36.49 | 66.95,36.49 67.19,36.49 67.82,37.12 69.41,37.12 71.63,39.34 71.63,39.66 | v66.95,35.85 66.95,36.49
  Bottom 0.254: v49.09,2.67 49.09,1.4 49.41,1.09 83.62,1.09 84.57,2.04 84.57,10.53 84.25,10.85 81.79,10.85 v81.79,11.17 | 17.18,14.82 16.94,15.06 v16.94,15.14 20.27,11.8 v35.44,11.8
  Bottom 0.305: J203.16 68.14,24.9 68.14,34.9 67.19,35.85 v66.95,35.85
DATA_DIR  (via drill 0.5 pad 1.02)
  Top 0.305: IC1.P$34 IC1.34 | IC3.1 77.09,48.7 v77.19,48.79 | IC2.1 86.3,47.03 v87.19,47.92
  Bottom 0.305: IC1.34 74.49,53.04 74.49,48.87 74.57,48.79 v77.19,48.79 86.95,48.79 87.19,48.55 v87.19,47.92
DP  (via drill 0.5 pad 1.02)
  Top 0.254: J201.P34 v75.12,12.12
  Top 0.305: IC203.12 IC203.9 47.87,38.66 48.29,38.31 v48.85,37.76 | R212.2 62.95,35.67 v62.74,35.93
  Bottom 0.254: J202.20 64.31,4.18 64.62,3.86 76.31,3.86 76.63,4.18 76.63,5.69 75.36,6.96 75.36,11.88 v75.12,12.12 | 62.9,34.9 62.74,35.06 v62.74,35.93
  Bottom 0.305: 62.9,34.9 65.6,32.04 65.6,24.9 J203.18 66.87,23.15 69.41,20.61 73.53,20.61 73.85,20.3 73.85,19.02 75.12,17.76 J201.P34 | v62.74,35.93 62.74,36.88 62.18,37.44 49.17,37.44 v48.85,37.76
GND  (via drill 0.5, 0.5 pad 1.02)
  Top 0.254: IC1.18 IC1.P$18 | IC1.13 IC1.P$13 | IC1.8 IC1.P$8 | IC1.3 IC1.P$3 | J202.7 65.68,7.83 66.95,6.56 68.31,6.56 J202.18 71,6.25 74.14,6.25 J202.16 | R224.1 59.14,31.8 v59.17,31.8 | 63.69,21.25 61.79,23.15 J203.22 | J101.15 23.86,3.94 27.1,3.94 28.22,5.06 J101.13 | IC101.19 14.11,41.3 13.84,41.57 13.84,42.84 13.21,43.47 | C208.2 21.89,37.86 23.21,39.18 C210.2
  Top 0.305: IC202.7 IC202.14 29.4,46.43 29.4,48.55 | IC1.23 IC1.P$23 46.57,51.99 IC203.14 IC203.7 46.57,38.71 46.55,38.71 | IC1.P$28 IC1.28 | IC1.P$33 IC1.33 | IC1.P$38 IC1.38 | IC2.19 85.65,42.84 85.43,43.15 85.4,43.16 80.52,43.16 80.45,43.22 | 80.45,43.22 IC2.10 | IC3.10 71.25,44.75 v71.23,44.58 | v71.23,42.44 76.08,42.44 76.44,42.07 IC3.19 76.44,38.98 76.71,38.71 78.61,38.71 78.93,39.03 78.93,41.7 80.45,43.22 | IC203.10 48.52,39.5 v49.33,39.5 | 63.69,21.25 64.96,21.25 66.23,19.98 66.23,18.87 67.5,17.91 67.5,16.72 68.3,16.41 68.93,15.21 69.17,14.66 69.88,14.26 70.36,14.26 71.39,15.14 J201.P36 | J203.20 64.33,22.84 66.39,20.77 67.82,20.77 68.77,19.82 68.77,19.02 70.12,17.68 70.12,17.12 71.15,16.09 72.27,16.64 72.82,16.64 73.14,16.56 73.61,16.09 73.85,15.61 J201.P35 | J202.9 61.6,9.34 64.25,9.34 J202.7 | C6.2 8.13,25.3 | 8.13,25.3 7.1,25.3 6.64,24.84 J2.MH4 | IC4.1 8.13,26.86 8.13,25.3 | IC5.10 71.55,84.5 71.55,83.85 | 71.55,83.85 71.55,83.2 | 71.55,83.2 71.55,82.55 | 71.55,82.55 71.55,81.9 | 71.55,81.9 71.55,81.25 IC5.5 | IC5.6 71.55,81.9 | IC5.7 71.55,82.55 | IC5.8 71.55,83.2 | IC5.9 71.55,83.85 | J1.4 78.61,85.38 | IC5.19 62.69,79.3 62.42,79.03 | 68.45,77.03 C1.1 | 45.62,77.47 C9.2 45.1,77.47 | IC6.3 47.54,82.5 49.75,82.5
  Top 0.406: C8.2 11.15,34.42 v11.15,34.5
  Top 0.61: C203.2 50.42,43.3 C202.2
  Bottom 0.254: v59.17,31.8 59.17,28.95 61.79,26.33 J203.21
  Bottom 0.305: 71.99,45.34 v71.23,44.58 v71.23,42.44 | J201.P19 J201.P18 | J201.P10 73.85,14.9 75.12,14.26 75.44,14.26 76.23,14.9 76.39,15.06 J201.P8 J201.P9 | J201.P16 66.23,18.07 J201.P17 | J203.30 51.63,22.68 51.95,22.36 65.36,22.36 66.15,21.56 66.15,19.02 66.55,18.63 67.42,17.99 67.5,17.91 J201.P40 | J201.P42 63.61,16.09 62.58,16.96 62.42,17.12 62.42,17.99 61.15,18.87 61.15,20.93 60.84,21.25 46.87,21.25 46.55,21.56 J203.34
  other vias: 32.74,40.93 41.23,40.61 54.09,48.71 54.09,57.58 42.1,57.6 42.1,67.13 59.41,67.21 88.78,45.62 87.43,39.27 69.01,45.93 77.5,38 72.27,84.6 70.68,77.13 62.22,84.4 46.97,78.15 11.15,22.44 26.7,19.58 23.85,23.39 27.66,15.77 22.58,17.36 19.08,17.36 37.5,14.82 46.39,8.47 89.57,12.28 89.89,21.49 74.96,43.71 81.95,44.66 81.95,42.44 91.16,48.16 64.41,45.54 42.1,63.32 55.44,67.13 52.26,67.13 48.77,67.13 35.75,70.53 35.75,76.8 51.84,85.08 82.98,87.38 64.84,57.58 78.34,57.58 78.93,47.76 83.26,57.58 72.09,57.58 69.34,59.08 74.59,57.58 80.84,57.58 49.09,57.58 46.59,57.58 38.6,70.63 11.9,45.5 19.15,43 5.4,39 5.4,51 6.65,11.69 14.4,12.19 19.86,10.64 28.41,10.27 34.91,10.27 45.84,75.29 66.56,75.75 62.75,76.22 42.11,82.26 62.4,78.71
  pour Top (isolate 0.406, rank 2): 34.44,88.88 92.9,88.88 92.9,0.29 0.19,0.29 0.19,52.75 34.5,52.75
  pour Bottom (isolate 0.305): 34.44,88.88 92.9,88.88 92.9,0.29 0.19,0.29 0.19,52.75 34.5,52.75
I/O  (via drill 0.5 pad 1.02)
  Top 0.254: J202.3 75.76,7.91 74.49,9.18 72.82,9.18 70.76,11.33 54.64,11.33 54.17,11.8 54.17,13.79 53.29,14.66 53.29,17.68 51.23,19.74 v41.78,19.74 | IC202.2 26.18,37.78 v25.35,36.8
  Top 0.305: IC202.2 IC202.19 | 24.78,35.67 R221.2 25.04,36.65 v25.35,36.8
  Bottom 0.254: 27.34,22.52 30.59,22.52 31.47,21.64 35.99,21.64 37.26,20.37 41.15,20.37 v41.78,19.74 42.18,20.14 51.47,20.14 54.41,17.2 54.41,15.93 J201.P50
  Bottom 0.305: 27.34,22.52 J203.50 26.07,23.63 24.96,24.74 24.96,36.49 v25.35,36.8
IN_OE_CS  (via drill 0.5, 0.5 pad 1.02)
  Top 0.254: IC1.15 IC1.P$15
  Top 0.305: IC201.19 34.83,48.34 v34.96,48.47 34.96,49.51 37.66,52.2 37.66,63.24 v39.17,64.75 | IC101.18 14.8,40.42 14.8,41.33 14.56,41.57 14.56,47.68 v14.8,47.92 | IC1.P$15 54.21,74.73 R6.2
  Bottom 0.254: 34.88,48.39 22.89,48.39 22.42,47.92 v14.8,47.92
  Bottom 0.305: v39.17,64.75 53.22,64.75 54.17,65.7 54.17,70.82 IC1.15 | v34.96,48.47 34.88,48.39
KEYB_RX  (via drill 0.5)
  Top 0.305: IC1.20 IC1.P$20 41.51,74.67 v40.83,75.46 | IC5.17 62.45,80.6 58.02,85.03 v55.86,85.03
  Bottom 0.305: v40.83,75.46 40.83,79.08 42.75,81 46.83,81 48.35,82.53 53.02,82.53 55.52,85.03 v55.86,85.03 55.83,85
KEYB_TX  (via drill 0.5)
  Top 0.305: IC1.29 IC1.P$29 | IC5.4 68.16,80.6 67.82,80.94 67.82,83.48 v66.87,83.48
  Bottom 0.305: IC1.29 61.83,55.26 62.42,55.85 70.06,55.85 70.68,56.47 70.68,74.07 65.6,79.15 65.6,83.16 65.91,83.48 v66.87,83.48
KEYB_TX_ORIG  (via drill 0.5, 0.5 pad 1.02)
  Top 0.305: IC1.P$32 IC1.32 69.45,56.85 v69.41,56.89 | v61.47,79.98 64.53,79.98 IC5.18
  Bottom 0.305: v69.41,56.89 65.6,60.7 65.6,74.91 65.59,74.91 64,76.5 64,78.5 62.5,80 61.48,80 v61.47,79.98
MSG  (via drill 0.5 pad 1.02)
  Top 0.254: 54.8,13.95 54.8,12.2 55.12,11.88 71.07,11.88 73.14,9.82 74.73,9.82 75.44,9.1 77.27,9.1 78.46,7.91 J202.2 | J203.42 37.9,22.28 v37.9,21.33 | 58.93,15.53 57.66,14.26 57.02,14.26 56.47,14.82 55.68,14.82 54.8,13.95 | 41.47,21.01 v41.23,21.33 41.63,20.93 50.83,20.93 53.77,17.99 53.77,15.06 54.8,14.02 54.8,13.95
  Top 0.305: IC202.12 30.73,44.69 31.31,44.11 31.31,42.84 30.73,42.26 IC202.9 30.73,37.31 v30.91,37.12 | 58.93,15.53 J201.P46 | R217.2 35.97,35.67 v35.44,35.22
  Bottom 0.254: v41.23,21.33 v37.9,21.33
  Bottom 0.305: 35.12,34.9 35.12,25.53 36.39,24.26 J203.42 | v30.91,37.12 32.89,37.12 35.12,34.9 | 35.67,35.46 v35.44,35.22 35.12,34.9
N$1
  Top 0.254: J2.B5 8.49,18.59 8.92,18.15 R4.1
N$2
  Top 0.254: J2.A5 8.45,19.59 8.77,19.9 R3.1
N$3
  Top 0.254: R250.1 R150.1
  Top 0.305: R150.1 51.79,79.33 46.89,79.33 46.55,79.67 46.55,81.57 46.87,81.89 IC6.2
N$4
  Top 0.254: R251.1 R151.1 51.85,81.24 IC6.1
N$5
  Top 0.305: R223.2 R224.2
N$6
  Top 0.305: LED1.C R5.1
N$7  (via drill 0.5)
  Top 0.305: LED2.3 44.89,86.49 44.64,86.24 v44.64,83.72 44.64,82.84 44.95,82.54 IC6.4
  Bottom 0.305: LED3.3 44.89,85.39 44.64,85.14 v44.64,83.72
N$8
  Top 0.305: 66.45,39.37 JP201.1 66.47,38.97 66.25,38.75 63.69,38.75 R203.2
N$12
  Top 0.305: Q202.3 R205.1
N$13
  Top 0.305: Q203.3 R206.1
N$14
  Top 0.305: Q204.3 R207.1
N$15
  Top 0.305: Q205.3 R208.1
N$18
  Top 0.305: Q206.3 R209.1
N$19
  Top 0.305: Q207.3 R210.1
N$20
  Top 0.305: Q208.3 R211.1
N$21
  Top 0.305: RN1.6 79.48,80.22 J1.2
N$22
  Top 0.305: Q209.3 R212.1
N$24
  Top 0.254: Q210.3 R213.1
N$26  (via drill 0.5 pad 1.02)
  Top 0.305: IC1.P$39 IC1.39
  Top 0.61: v89.41,76.17 87.02,76.17 D1.C
  Bottom 0.305: 87.27,53.08 IC1.39
  Bottom 0.61: v89.41,76.17 91.31,76.17 91.63,75.86 91.63,56.49 91.31,56.17 87.82,56.17 87.27,55.62 87.27,53.08
N$30
  Top 0.305: 54.09,32.12 R222.2
  Top 0.61: R223.1 R222.2 | IC204.1 54.09,32.12
N$100
  Top 0.254: Q211.3 R214.1
N$101
  Top 0.254: Q212.3 R215.1
N$102
  Top 0.254: Q213.3 R216.1
N$103
  Top 0.254: Q214.3 R217.1
N$104
  Top 0.254: Q215.3 R218.1
N$105
  Top 0.254: Q216.3 R219.1
N$106
  Top 0.254: Q217.3 R220.1
N$107
  Top 0.254: Q218.3 R221.1
OC_DRQ
  Top 0.254: RN104.6 11.86,14.19 17.66,19.98 D102.2
OC_INT
  Top 0.254: RN104.7 11.06,14.34 14.8,18.07 D101.2
ODRQ  (via drill 0.5)
  Top 0.254: IC101.13 18.01,37.8 v17.66,37.44 | D102.1 v17.66,24.42
  Bottom 0.305: v17.66,24.42 16.39,24.42 15.43,25.38 15.43,36.8 16.07,37.44 v17.66,37.44
OINT  (via drill 0.5)
  Top 0.254: IC101.14 17.36,39.13 16.7,38.47 v16.7,38.39 | D101.1 14.8,23.47
  Top 0.305: 14.8,23.47 v14.8,24.42
  Bottom 0.305: v14.8,24.42 14.8,37.76 15.43,38.39 v16.7,38.39
OUT_LE1_DRQ  (via drill 0.5, 0.5 pad 1.02)
  Top 0.254: IC1.17 IC1.P$17 | IC101.7 17.36,32.81 17.5,32.68 20.12,32.68 20.27,32.84 20.27,38 21.54,39.27 21.54,40.54 22.58,41.57 24.32,41.57 24.64,41.88 v24.64,42.2 | v32.34,46.33 32.26,46.41 IC202.11 | v55.44,78.64 55.33,78.64 55.15,78.45 54.75,78.11 54.64,78 R250.2
  Top 0.305: IC202.11 31.38,47.85 30.59,48.63 30.59,50.62 30.83,50.77 34.4,50.77 36.39,52.76 36.39,66.02 v38.77,68.4 | IC1.P$17 49.13,74.81 R8.2 48.35,74.77 v47.82,75.3
  Bottom 0.254: v24.64,42.2 25.91,42.2 30.04,46.33 v32.34,46.33 | v55.44,78.64 54.89,78.64 51.55,75.3 v47.82,75.3
  Bottom 0.305: v38.77,68.4 48.81,68.4 49.13,68.71 IC1.17 49.13,70.94
OUT_LE2_RESET  (via drill 0.5)
  Top 0.254: IC1.19 43.94,71.09 44.01,71.09 44.01,72.08 IC1.P$19
  Top 0.305: IC203.11 48.52,48.29 | 48.52,48.29 48.52,49.44 47.82,50.14 47.82,65.38 44.05,69.15 IC1.19 | 48.52,48.29 48.82,48.29 v48.85,48.31 | v16.7,49.51 16.7,44.11 16.94,43.87 16.94,41.73 16.7,41.49 IC101.15 | v42.66,75.46 42.74,75.46 44.01,74.19 44.01,72.01 IC1.P$19 | R251.2 53.85,83.08 55.33,83.08 v55.83,82.58
  Bottom 0.305: v48.85,48.31 48.53,48.31 47.98,47.76 42.58,47.76 41.39,48.95 35.83,48.95 35.28,49.51 34.16,49.51 33.61,48.95 17.26,48.95 v16.7,49.51 | v55.83,82.58 55.33,82.58 54.5,81.75 48.5,81.75 42.66,75.91 v42.66,75.46
OUT_OE_INT  (via drill 0.5 pad 1.02)
  Top 0.254: IC1.16 IC1.P$16 | v25.27,39.19 25.52,39.2 IC202.1 25.52,40.93 22.73,40.93 22.1,40.3 22.1,39.03 20.83,37.76 20.83,32.36 20.51,32.04 17.02,32.04 16.71,32.35 IC101.6
  Top 0.305: IC203.1 42.67,43.7 41.39,44.98 v41.39,45.38 | v50.36,48.95 50.36,68.56 51.67,69.87 IC1.16 | IC1.P$16 51.67,74.73 R7.2
  Bottom 0.254: v41.39,45.38 50.67,45.38 51.31,46.01 51.31,47.6
  Bottom 0.305: 51.31,47.6 50.36,48.55 v50.36,48.95 | v41.39,45.38 30.28,45.46 26.86,42.04 26.86,40.3 25.91,39.19 v25.27,39.19
REQ  (via drill 0.5 pad 1.02)
  Top 0.254: J201.P49 56.07,12.68 56.39,12.36 71.44,12.36 73.43,10.37 75.04,10.37 75.76,9.66 77.58,9.66 77.98,9.26 80.04,9.26 81.4,7.91 J202.1 | v29.32,21.56 29.32,22.91 J203.48
  Top 0.305: IC203.19 IC203.2 43.32,39.29 43.05,39.03 v41.39,39.03 | v26.7,36.8 R220.2
  Bottom 0.254: 26.7,34.42 v26.7,36.8 | 55.75,13.63 54.8,13.63 53.77,14.66 53.77,17.04 51.23,19.58 42.98,19.58 42.26,18.87 41.23,18.87 40.36,19.74 37.02,19.74 35.75,21.01 31.23,21.01 30.75,21.49 29.4,21.49 v29.32,21.56
  Bottom 0.305: v41.39,39.03 41.23,39.03 40.52,39.74 31.23,39.74 29.32,37.84 27.74,37.84 v26.7,36.8 | J201.P49 55.75,13.63 | J203.48 28.77,24.26 27.5,25.53 27.5,33.63 26.7,34.42
RST  (via drill 0.5 pad 1.02)
  Top 0.254: v53.22,11.33 53.93,10.85 70.28,10.85 73.22,7.91 J202.4
  Top 0.305: IC201.3 35.48,37.56 v35.51,37.52 | v38.93,18.31 J203.40 | v39.09,35.69 40.97,35.69 R216.2
  Bottom 0.254: v53.22,11.33 53.22,12.04 50.67,12.04 44.8,17.91 39.24,17.91 v38.93,18.31
  Bottom 0.305: 37.66,35.38 37.66,25.45 38.93,24.18 J203.40 | J201.P45 59.24,11.88 54.48,11.88 54.17,12.04 53.22,12.04 | 38.93,18.23 v38.93,18.31 | 37.66,35.38 v35.51,37.52 | 37.66,35.38 37.98,35.69 v39.09,35.69
RST_C/D_REQ  (via drill 0.5 pad 1.02)
  Top 0.254: IC1.12 IC1.P$12
  Top 0.305: IC202.4 IC202.17 27.48,47.58 27.82,47.92 v27.82,50.77 | IC203.3 IC203.18 v43.97,49.35 | v39.88,59.66 38.93,58.71 38.93,51.25 38.25,50.58 v38.29,50.54 38.29,49.51 36.13,47.34 IC201.17 | IC1.P$12 61.83,73.28 61.51,73.28 61.23,73.56 61.23,74.19 60.28,75.14 57.5,75.14 56.55,76.1 56.55,79.19 56.15,79.59 54.22,79.59 R150.2
  Bottom 0.305: v39.88,59.66 60.84,59.66 61.79,60.62 61.79,70.82 IC1.12 | v43.97,49.35 42.78,50.54 v38.29,50.54 37.26,50.54 36.7,51.09 28.13,51.09 v27.82,50.77
SEL  (via drill 0.5 pad 1.02)
  Top 0.254: R218.2 33.85,37.84 | 33.85,21.01 J203.44
  Top 0.305: IC201.2 34.83,38.82 33.85,37.84 | 33.85,21.01 v33.85,19.98 | R218.2 32.24,35.67 v31.94,35.38
  Bottom 0.254: J202.19 67.05,8.37 62.5,12.91 62.5,13.87 61.55,14.82 60.76,14.82 59.57,13.63 J201.P47 | v33.85,19.98 34.64,19.18 40.04,19.18 40.83,18.39 42.66,18.39 43.37,19.1 50.91,19.1 53.29,16.72 53.29,14.18 54.8,12.68
  Bottom 0.305: 33.69,23.63 J203.44 33.85,24.34 32.58,25.61 32.58,34.74 v31.94,35.38 | 54.8,12.68 55.12,12.52 57.34,12.52 J201.P47
SEL_I/O_DP_A1  (via drill 0.5, 0.5 pad 1.02)
  Top 0.254: IC1.11 IC1.P$11
  Top 0.305: IC202.3 IC202.18 26.82,49.82 v26.86,49.82 | IC203.8 IC203.13 47.22,48.83 v47.5,49.11 | v60.2,61.57 v63.06,61.57 | v39.72,61.49 38.29,60.06 38.29,51.92 36.63,50.26 v36.63,49.82 36.63,48.63 35.48,47.48 IC201.18 | 64.41,72.01 IC1.P$11 64.33,72.01 | v15.43,49.82 15.43,49.19 15.75,48.87 15.75,44.11 15.19,43.55 15.19,41.81 15.43,41.57 15.43,40.4 IC101.17
  Bottom 0.305: IC1.11 64.26,70.4 64.26,62.78 v63.06,61.57 | v39.72,61.49 39.96,61.57 v60.2,61.57 | v47.5,49.11 47.42,49.19 45.59,49.19 44.72,48.31 43.61,48.31 42.26,49.66 36.78,49.66 v36.63,49.82 35.99,50.46 29.09,50.46 28.45,49.82 v26.86,49.82 19.24,49.82 18.61,50.46 16.07,50.46 v15.43,49.82
TP_ON  (via drill 0.5 pad 1.02)
  Top 0.254: Q201.1 89.09,31.09 88.78,31.41 85.52,31.41 | 85.52,31.41 81.95,31.41 | 81.95,31.41 78.38,31.41 | 78.38,31.41 74.81,31.41 | 74.81,31.41 71.24,31.41 | 71.24,31.41 67.66,31.41 | 67.66,31.41 64.09,31.41 | 64.09,31.41 63.93,31.41 60.52,31.41 Q209.1 | Q209.1 | Q208.1 64.09,31.41 | Q207.1 67.66,31.41 | Q206.1 71.24,31.41 | Q205.1 74.81,31.41 | Q204.1 78.38,31.41 | Q203.1 81.95,31.41 | Q202.1 85.52,31.41 | Q218.1 22.18,31.09 22.5,31.41 25.75,31.41 | 25.75,31.41 29.33,31.41 | 29.33,31.41 32.9,31.41 | 32.9,31.41 36.47,31.41 | 36.47,31.41 40.04,31.41 | 40.04,31.41 43.61,31.41 | 43.61,31.41 47.18,31.41 | 47.18,31.41 49.96,31.41 | 49.96,31.41 50.44,31.41 50.76,31.09 Q210.1 | Q211.1 47.18,31.41 | Q212.1 43.61,31.41 | Q213.1 40.04,31.41 | Q214.1 36.47,31.41 | Q215.1 32.9,31.41 | Q216.1 29.33,31.41 | Q217.1 25.75,31.41 | Q209.1 60.44,30.36 60.44,32.92 v60.2,32.92 | v49.96,32.92 49.96,31.41
  Top 0.305: 63.93,31.41 63.85,31.49 63.85,36.88 63.49,37.25 62.25,37.25 61.94,37.56 R203.1 R202.2
  Bottom 0.254: v60.2,32.92 60.2,33.15 59.88,33.47 50.67,33.47 49.96,32.84 v49.96,32.92
VBUS
  Top 0.305: IC1.P$40 IC1.40
VCC  (via drill 0.5)
  Top 0.254: R103.1 R102.1 13.46,27.93 IC101.1 13.46,36.49 | 13.46,36.49 IC101.20 | C101.1 13.36,36.59 13.46,36.49
  Top 0.305: IC201.1 34.18,43.09 | 34.18,43.09 IC201.20 34.18,47.43 33.77,47.84 33.77,49.43 33.53,49.66 C201.1 34.16,49.66 37.02,52.52 37.02,64.75 39.88,67.6 39.88,75.79 40.56,76.47 R8.1 R7.1 R6.1 55.14,77.44 v55.44,77.44 | 34.18,43.09 33.86,43.09 v33.85,43.08 | v12.5,42.2 13.46,41.24 IC101.20 | 11.17,29.18 IC4.2 IC4.4 | 11.17,29.18 C4.1 | 11.3,27.18 C5.1 13.53,27.18 R102.1 | 11.3,27.18 10.53,27.18 C6.1 | 11.17,29.18 11.17,27.32 11.3,27.18 | IC5.1 IC5.20 64.64,78.57 64.64,77.44 | C1.2 64.96,77.13 64.64,77.44 | R101.2 91.21,41.78 90.52,42.6 90.52,46.33 90.2,46.65 v89.81,46.65 | v63.38,48.23 64.43,48.23 R125.1 | v58.61,77.44 64.64,77.44
  Bottom 0.305: v12.5,42.2 14.08,40.61 17.34,40.61 19.88,38.08 20.27,37.76 26.23,37.76 28.45,39.98 29.24,39.98 32.34,43.08 v33.85,43.08 35.04,43.08 35.12,43.16 37.02,43.16 37.34,42.84 44.64,42.84 45.28,42.2 54.48,42.2 56.07,43.79 61.15,43.79 63.38,46.01 63.38,47 | v89.81,46.65 74.17,46.65 73.82,47 63.38,47 | 63.38,47 v63.38,48.23 | v55.44,77.44 v58.61,77.44
  pour Top (isolate 0.406): 0.19,25.38 0.19,34.27 9.16,34.34 9.16,25.45
VCCBUS  (via drill 0.5)
  Top 0.305: IC3.20 77.09,42.91 | 77.09,42.91 77.9,43.71 78.91,43.71 C3.1 | IC2.20 86.3,42.19 86.73,42.62 86.87,42.62 | 86.87,42.62 C2.1 89.51,41.88 R101.1 R201.1 | 77.09,42.91 77.16,42.84 v77.03,42.84 | v86.87,43.47 86.87,42.62
  Bottom 0.305: v77.03,42.84 77.66,43.47 v86.87,43.47
VCCIO  (via drill 0.5, 0.5 pad 1.02)
  Top 0.305: IC203.20 42.66,46.42 42.66,47.2 v41.39,47.2 41.39,48.85 C204.1 | R222.1 56.39,32.12 | 25.2,48.91 C205.1 25.52,48.63 25.52,46.97 | v56.39,42.52 IC204.4 | IC202.20 25.52,46.97 | v24.8,47.12 25.37,47.12 25.52,46.97 | R201.2 v91.24,38.71 | v91.39,33.71 91.39,33.39 91.31,33.39 | v61.87,43.16 61.95,43.08 R202.1
  Top 0.61: 24.08,28.23 27.65,28.23 | 27.65,28.23 31.23,28.23 | 31.23,28.23 34.8,28.23 | 34.8,28.23 38.37,28.23 | 38.37,28.23 41.94,28.23 | 41.94,28.23 45.51,28.23 | 45.51,28.23 49.09,28.23 | 49.09,28.23 52.66,28.23 | 52.66,28.23 52.9,28.23 | 52.9,28.23 62.42,28.23 | 62.42,28.23 66.23,28.23 | 66.23,28.23 69.41,28.23 | 69.41,28.23 73.22,28.23 | 73.22,28.23 76.71,28.23 | 76.71,28.23 80.2,28.23 | 80.2,28.23 83.69,28.23 | 83.69,28.23 87.5,28.23 | 87.5,28.23 90.92,28.23 91,28.31 Q201.2 91,31.01 91.47,31.49 91.47,33.23 91.31,33.39 91.19,33.52 | 50.99,36.8 52.9,36.8 | 52.9,36.8 56.39,36.8 IC204.2 56.39,32.12 | C202.1 52.26,46.26 51.31,46.25 49.8,46.25 49.64,46.41 v49.64,47.2 | Q202.2 87.42,28.31 87.5,28.23 | Q203.2 83.85,28.39 83.69,28.23 | Q204.2 80.28,28.31 80.2,28.23 | Q205.2 76.71,28.23 | Q206.2 73.14,28.31 73.22,28.23 | Q207.2 69.56,28.39 69.41,28.23 | Q208.2 65.99,28.47 66.23,28.23 | Q209.2 62.42,28.23 | 24.08,28.23 Q218.2 | Q217.2 27.65,28.23 | Q216.2 31.23,28.23 | Q215.2 34.8,28.23 | Q214.2 38.37,28.23 | Q213.2 41.94,28.23 | Q212.2 45.51,28.23 | Q211.2 49.09,28.23 | 52.66,28.23 Q210.2 52.9,30.6 | 52.9,30.6 52.9,36.8 | 52.9,28.23 52.9,30.6 | 24.08,28.23 v23.85,28.23 | 23.77,37.28 C210.1 23.61,37.12 23.61,35.8 C208.1 23.59,34.84 v23.61,34.82 | 91,34.66 91,33.52 91.19,33.52 | 91,34.66 C211.1 | 91,34.66 89.83,34.66 C209.1 | 91.19,33.52 91.2,33.52 91,33.63
  Bottom 0.305: v24.8,47.12 24.88,47.2 v41.39,47.2 v49.64,47.2 | v61.87,43.16 57.34,43.16 v56.39,42.52 | v91.24,38.71 91.24,33.71 v91.39,33.71
  Bottom 0.61: v23.85,28.23 23.69,28.55 23.69,34.34 v23.61,34.82
  pour Top (isolate 0.406): 50.67,36.49 59.88,36.49 59.88,47.28 50.67,47.28
ZKEYB_RX
  Top 0.305: RN1.8 77.91,81.82 78.93,82.84 J1.3
ZKEYB_TX_ORIG
  Top 0.305: RN1.5 78.53,77.76 J1.1

## Text on the board
tNames: Cosmo2ex HDD 4.05 | GND | IKBD | RX | TX | TX_ORIG | A | S | JUMPER | TRMPWR | PRESENT | ON | REMOVED | OFF | A | S | TERMPWR | Falcon ext | ACSI | TT ext
bNames: GND | RX | TX | IKBD | TX_ORIG | TERMPWR | Falcon ext | ACSI | TT ext